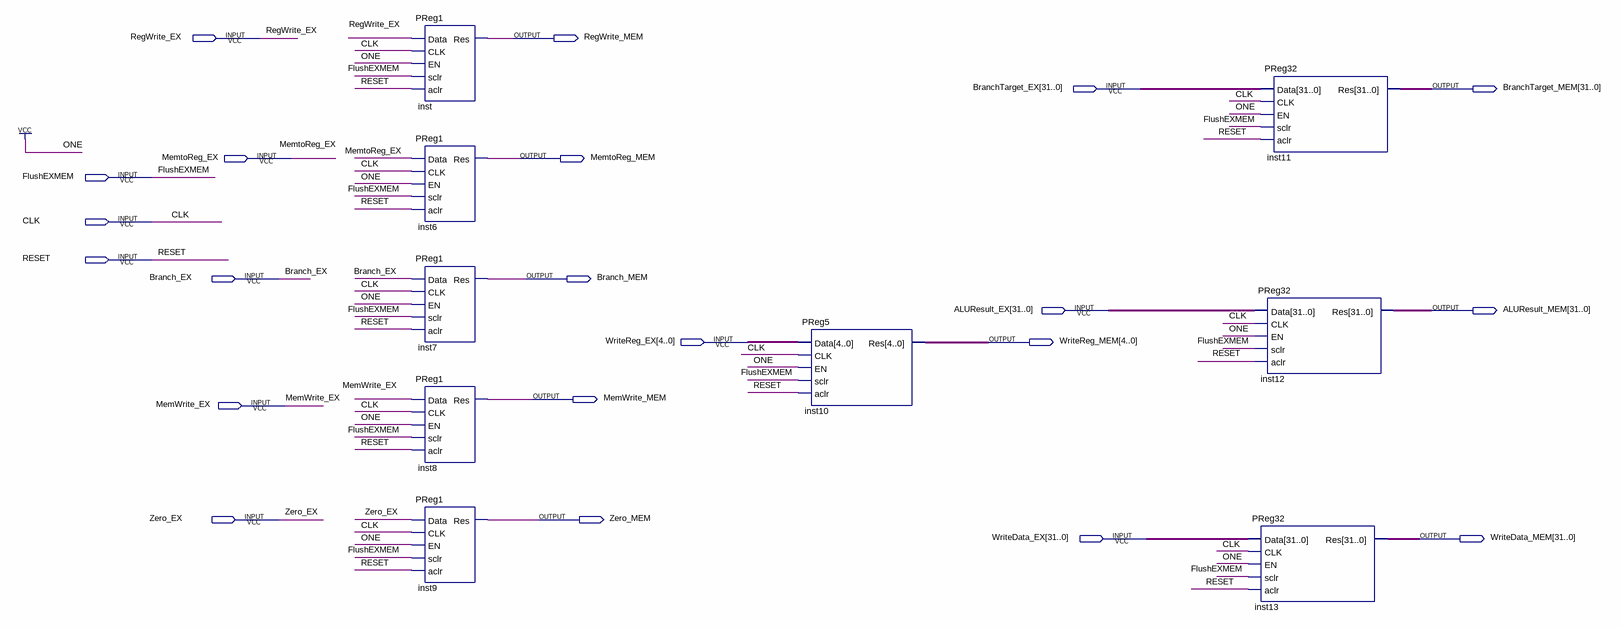
[diagram p0: schematic sheet]
// Quartus schematic EX_MEM.bdf as structural Verilog: 9 symbols, 21 pins
module EX_MEM (
  input  RegWrite_EX,
  input  [31:0] BranchTarget_EX,
  input  MemtoReg_EX,
  input  FlushEXMEM,
  input  CLK,
  input  RESET,
  input  Branch_EX,
  input  [31:0] ALUResult_EX,
  input  [4:0] WriteReg_EX,
  input  MemWrite_EX,
  input  Zero_EX,
  input  [31:0] WriteData_EX,
  output RegWrite_MEM,
  output [31:0] BranchTarget_MEM,
  output MemtoReg_MEM,
  output Branch_MEM,
  output [31:0] ALUResult_MEM,
  output [4:0] WriteReg_MEM,
  output MemWrite_MEM,
  output Zero_MEM,
  output [31:0] WriteData_MEM
);

  PReg1 inst (.Data(RegWrite_EX), .CLK(CLK), .EN(1'b1), .sclr(FlushEXMEM), .aclr(RESET), .Res(RegWrite_MEM));
  PReg1 inst6 (.Data(MemtoReg_EX), .CLK(CLK), .EN(1'b1), .sclr(FlushEXMEM), .aclr(RESET), .Res(MemtoReg_MEM));
  PReg1 inst7 (.Data(Branch_EX), .CLK(CLK), .EN(1'b1), .sclr(FlushEXMEM), .aclr(RESET), .Res(Branch_MEM));
  PReg1 inst8 (.Data(MemWrite_EX), .CLK(CLK), .EN(1'b1), .sclr(FlushEXMEM), .aclr(RESET), .Res(MemWrite_MEM));
  PReg1 inst9 (.Data(Zero_EX), .CLK(CLK), .EN(1'b1), .sclr(FlushEXMEM), .aclr(RESET), .Res(Zero_MEM));
  PReg5 inst10 (.Data(WriteReg_EX), .CLK(CLK), .EN(1'b1), .sclr(FlushEXMEM), .aclr(RESET), .Res(WriteReg_MEM));
  PReg32 inst11 (.Data(BranchTarget_EX), .CLK(CLK), .EN(1'b1), .sclr(FlushEXMEM), .aclr(RESET), .Res(BranchTarget_MEM));
  PReg32 inst12 (.Data(ALUResult_EX), .CLK(CLK), .EN(1'b1), .sclr(FlushEXMEM), .aclr(RESET), .Res(ALUResult_MEM));
  PReg32 inst13 (.Data(WriteData_EX), .CLK(CLK), .EN(1'b1), .sclr(FlushEXMEM), .aclr(RESET), .Res(WriteData_MEM));
endmodule
